# Altium schematic sheet Mechanical_design_of_the_sensor.SchDoc
size A4; DrawnBy: Yusuf Yasser; SheetNumber: 3; SheetTotal: 11
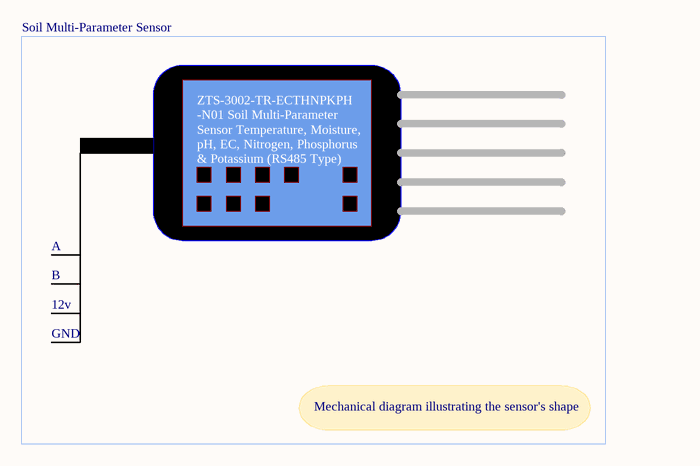
[diagram p0: Mechanical_design_of_the_sensor.SchDoc]

## Notes on the sheet
- Soil Multi-Parameter Sensor
- ZTS-3002-TR-ECTHNPKPH
- -N01 Soil Multi-Parameter
- Sensor Temperature, Moisture,
- pH, EC, Nitrogen, Phosphorus
- & Potassium (RS485 Type)
- A
- B
- 12v
- GND
- Mechanical diagram illustrating the sensor's shape